# Altium schematic sheet I2C Mux_Sheet.SchDoc
size A4; SheetNumber: 4; SheetTotal: 5
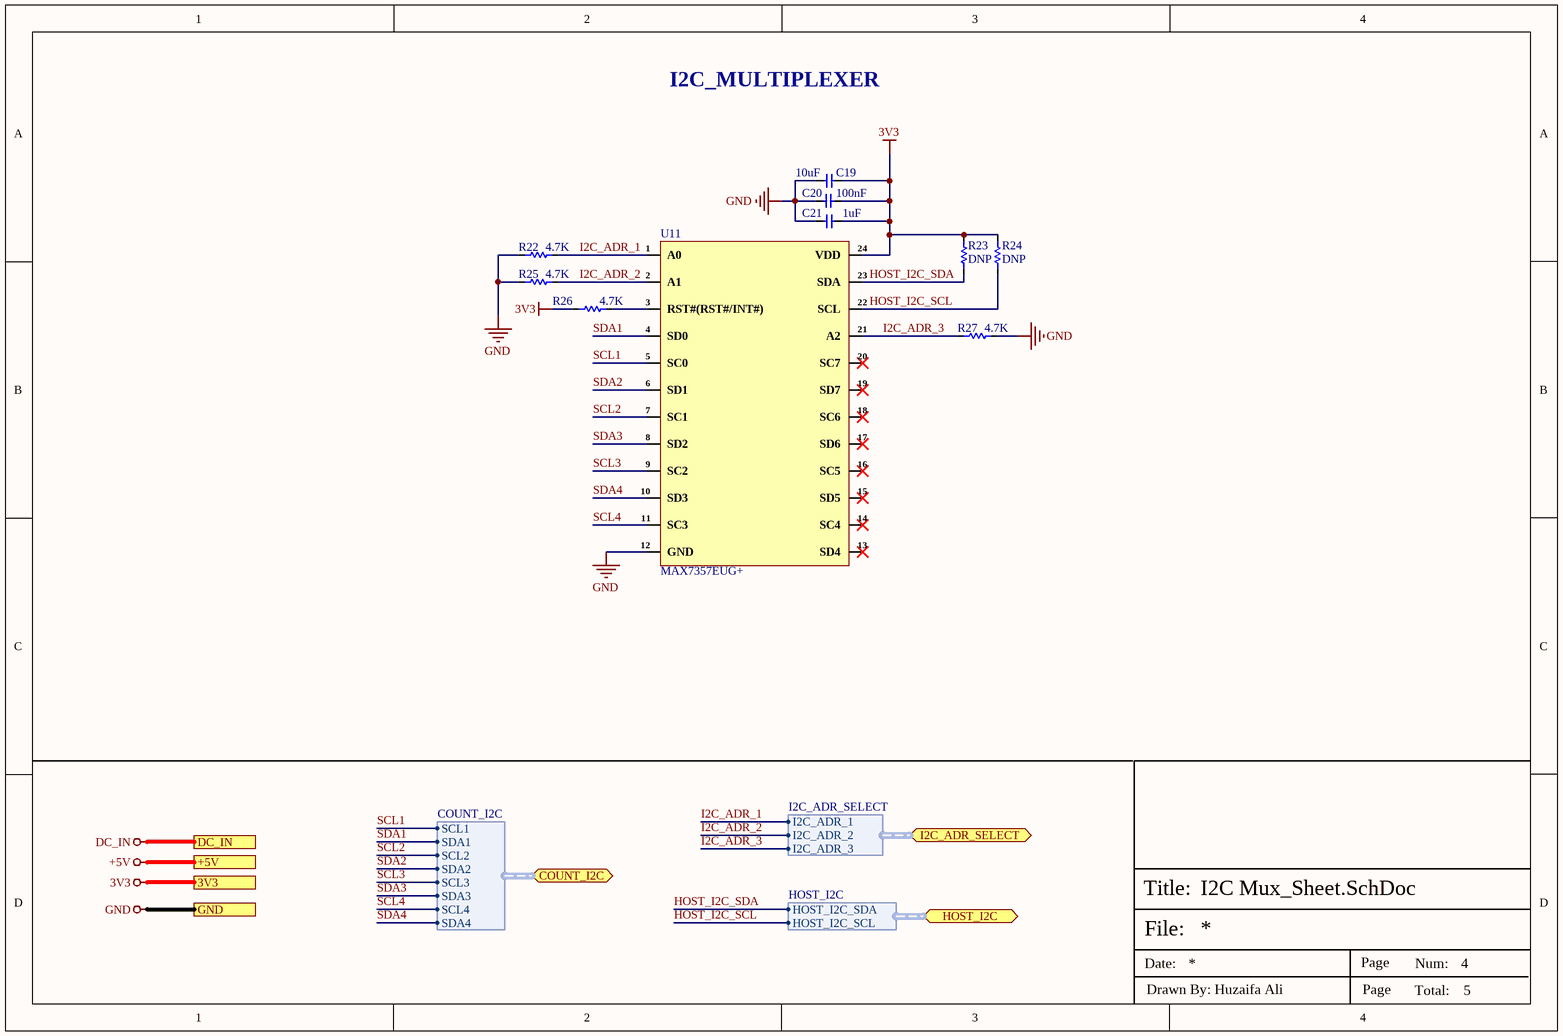
[diagram p0: I2C Mux_Sheet.SchDoc]

## Parts
C19  10uF  [Cap-0603]
C20  100nF  [cap-0402]
C21  1uF  [Cap-0402]
R22  4.7K  [Res-0402]
R23  DNP  [Res-0402]
R24  DNP  [Res-0402]
R25  4.7K  [Res-0402]
R26  4.7K  [Res-0402]
R27  4.7K  [Res-0402]
U11  MAX7357EUG+  [24-TSSOP]

## Ports
3V3, +5V, COUNT_I2C (bidir, harness COUNT_I2C), DC_IN, GND, HOST_I2C (bidir, harness HOST_I2C), I2C_ADR_SELECT (bidir, harness I2C_ADR_SELECT)

## Harnesses
COUNT_I2C: SCL1, SDA1, SCL2, SDA2, SCL3, SDA3, SCL4, SDA4
I2C_ADR_SELECT: I2C_ADR_1, I2C_ADR_2, I2C_ADR_3
HOST_I2C: HOST_I2C_SDA, HOST_I2C_SCL

## Nets
3V3: C19.1 C20.2 C21.1 R23.2 R24.2 R26.1 U11.24(VDD) ; port 3V3
+5V: port +5V
DC_IN: port DC_IN
GND: C19.2 C20.1 C21.2 R22.1 R25.1 R27.2 U11.12(GND) ; port GND
HOST_I2C_SCL: R24.1 U11.22(SCL) ; port HOST_I2C.HOST_I2C_SCL
HOST_I2C_SDA: R23.1 U11.23(SDA) ; port HOST_I2C.HOST_I2C_SDA
I2C_ADR_1: R22.2 U11.1(A0) ; port I2C_ADR_SELECT.I2C_ADR_1
I2C_ADR_2: R25.2 U11.2(A1) ; port I2C_ADR_SELECT.I2C_ADR_2
I2C_ADR_3: R27.1 U11.21(A2) ; port I2C_ADR_SELECT.I2C_ADR_3
SCL1: U11.5(SC0) ; port COUNT_I2C.SCL1
SCL2: U11.7(SC1) ; port COUNT_I2C.SCL2
SCL3: U11.9(SC2) ; port COUNT_I2C.SCL3
SCL4: U11.11(SC3) ; port COUNT_I2C.SCL4
SDA1: U11.4(SD0) ; port COUNT_I2C.SDA1
SDA2: U11.6(SD1) ; port COUNT_I2C.SDA2
SDA3: U11.8(SD2) ; port COUNT_I2C.SDA3
SDA4: U11.10(SD3) ; port COUNT_I2C.SDA4
NetR26_2: R26.2 U11.3(RST#(RST#/INT#))

Not connected (* = marked no-connect by the designer): U11 13(SD4)* 14(SC4)* 15(SD5)* 16(SC5)* 17(SD6)* 18(SC6)* 19(SD7)* 20(SC7)*

## Notes on the sheet
- I2C_MULTIPLEXER
- File:
- Title:
- Date:
- Page
- Num:
- Total:
- Drawn By: Huzaifa Ali

## Library data of the parts
C19 = C1608X5R1E106M080AC: CAP CER 10UF 25V X5R 0603; Manufacturer: TDK; Dielectric Material: Ceramic; Tolerance: 20%; Item Type: Capacitor; Supplier 1: Digi-Key; Manufacturer Part Number: C1608X5R1E106M080AC; Stock 1: 61681; Pricing 1: 1=0.96, 10=0.704, 100=0.483, 500=0.38238, 1000=0.322 (USD); Mount: Surface Mount; Case/Package: 0603; Weight: 7.1E-05oz; Case Code (Imperial): 0603; Case Code (Metric): 1608; Min Operating Temperature: -55°C; Max Operating Temperature: 85°C; Capacitance: 10uF; Packaging: Tape and Reel; Voltage Rating: 25V; Voltage Rating (DC): 25V; Termination: SMD/SMT; Package Quantity: 1; Dielectric: X5R; Composition: Ceramic; Length: 1.6mm; Height: 0.8mm; Width: 0.8mm; Thickness: 0.039inch; Depth: 0.8mm; Lead Free: Lead Free; REACH SVHC: No SVHC; Supplier Part Number 1: 445-9015-1-ND; LCSC Part Number: C2168289
C20 = C1005X7R1H104KT000F: CAP CER 0.1UF 50V X7R 0402; Manufacturer: TDK; Tolerance: 10%; Voltage: 25V; Item Type: Capacitor; Supplier 1: Avnet; Manufacturer Part Number: C1005X7R1H104KT000F; RoHS: No; Category: Ceramic Capacitors; Dielectric: X7R; Supplier Part Number 1: C1005X7R1H104KT000F; LCSC Part Number: C361198; ComponentLink1Description: LCSC; ComponentLink1URL: https://www.lcsc.com/product-detail/Multilayer-Ceramic-Capacitors-MLCC-SMD-SMT_TDK-C1005X7R1H104KT000F_C361198.html
C21 = C1005X5R1V105K050BC: CAP CER 1UF 35V X5R 0402; Manufacturer: TDK; Item Type: Capacitors; Dielectric Material: Ceramic; Material: 4241ConductorMaterial; Tolerance: 10%; Supplier: Digikey; Supplier Part Number: 445-9073-1-ND; Manufacturer Part Number: C1005X5R1V105K050BC; RoHS: Yes; Stock: 682645; Pricing: 1=0.15, 10=0.087, 50=0.061, 100=0.0528, 500=0.03898, 1000=0.03468, 2500=0.03011, 5000=0.02735 (USD); Mounting Technology: Surface Mount; Case/Package: 0402; Case Code (Metric): 1005; Case Code (Imperial): 0402; Min Operating Temperature: -55°C; Max Operating Temperature: 85°C; Value: 1uF; Voltage Rating: 35V; Packaging: Tape and Reel; Dielectric: X5R; Series: C; Length: 1mm; Depth: 0.5mm; Radiation Hardening: No; Reach SVHC Compliant: No; Lead Free: Lead Free; RoHS Compliant: Yes; ComponentLink1URL: https://datasheet.ciiva.com/26834/getdatasheetpartid-750449-26834298.pdf?src-supplier=Verical; ComponentLink1Description: https://datasheet.ciiva.com/26834/getdatasheetpartid-750449-26834298.pdf?src-supplier=Verical; ComponentLink2URL: https://datasheet.ciiva.com/28451/1796654-28451087.pdf?src-supplier=Element14; ComponentLink2Description: https://datasheet.ciiva.com/28451/1796654-28451087.pdf?src-supplier=Element14; ComponentLink3URL: https://datasheet.ciiva.com/22719/1796654-22719533.pdf?src-supplier=Element14; ComponentLink3Description: https://datasheet.ciiva.com/22719/1796654-22719533.pdf?src-supplier=Element14
R22-R27 = RC0402FR-074K7L: RES 4.7K OHM 1% 1/16W 0402; Manufacturer: Yageo; Voltage Rating (DC): 50V; Power Rating: 62.5mW; Resistance: 4.7kR; Temperature Coefficient: 100ppm/°C; Max Power Dissipation: 63mW; Item Type: Resistor; Supplier 1: Avnet; Manufacturer Part Number: RC0402FR-074K7L; RoHS: Yes; Category: Chip SMD Resistors; Stock 1: 2420000; Pricing 1: 10000=0.00085 (USD); Case/Package: 0402; Number of Pins: 2; Case Code (Imperial): 0402; Case Code (Metric): 1005; Size Code: 0402; Min Operating Temperature: -55°C; Max Operating Temperature: 155°C; Tolerance: 1%; Voltage Rating: 50V; Packaging: Tape and Reel; Resistor Type: Thick Film; Termination: SMD/SMT; Features: Moisture Resistant; Series: RC; Number of Terminations: 2; Resistance Tolerance: 1%; Construction: Rectangular; Length: 1mm; Width: 0.5mm; Height: 0.32mm; Depth: 0.5mm; Height - Seated (Max): 0.016inch; RoHS Compliant: Yes; Reach SVHC Compliant: Yes; Military Standard: Not; Lead Free: Lead Free; ComponentLink1URL: https://datasheet.ciiva.com/22661/1686128-22661342.pdf?src-supplier=Element14; ComponentLink1Description: https://datasheet.ciiva.com/22661/1686128-22661342.pdf?src-supplier=Element14; ComponentLink2URL: https://datasheet.ciiva.com/7850/1018594-7850022.pdf?src-supplier=Element14; ComponentLink2Description: https://datasheet.ciiva.com/7850/1018594-7850022.pdf?src-supplier=Element14; ComponentLink3URL: https://datasheet.ciiva.com/7850/1018594-7850023.pdf?src-supplier=Element14; ComponentLink3Description: https://datasheet.ciiva.com/7850/1018594-7850023.pdf?src-supplier=Element14; ComponentLink4URL: https://datasheet.ciiva.com/15215/getdatasheetpartid-328119-15215035.pdf?src-supplier=Verical; ComponentLink4Description: https://datasheet.ciiva.com/15215/getdatasheetpartid-328119-15215035.pdf?src-supplier=Verical; Supplier Part Number 1: RC0402FR-074K7L; LCSC Part Number: C105871
U11 = MAX7357EUG+: IC MULTIPLEXER 8X1 24TSSOP; Manufacturer: Maxim; Supply Type: Single; Propagation Delay: 0.3ns; Max Power Dissipation: 1.11W; Number of Channels: 8; Operating Supply Current: 65uA; Operating Supply Voltage: 5.5V; Supplier: Mouser; LCSC Part Number: C1557096; Manufacturer Part Number: MAX7357EUG+; RoHS: Yes; Category: Interface ICs; Item Type: IC; Pricing: 1=7.78, 10=6.09, 50=4.85, 100=4.47, 1000=4.13, 10000=4.12 (USD); Mounting Technology: Surface Mount; Case/Package: TSSOP; Pins: 24; Min Operating Temperature: -40°C; Max Operating Temperature: 85°C; Packaging: Rail/Tube; Package Quantity: 62; Logic Function: Multiplexer; Series: -; RoHS Compliant: Yes; ComponentLink1URL: https://datasheet.ciiva.com/1676/max7356-max7358-1676412.pdf?src-supplier=Digikey; ComponentLink1Description: https://datasheet.ciiva.com/1676/max7356-max7358-1676412.pdf?src-supplier=Digikey; ComponentLink2URL: https://datasheet.ciiva.com/14295/max7356-max7358-14295500.pdf?src-supplier=Avnet; ComponentLink2Description: https://datasheet.ciiva.com/14295/max7356-max7358-14295500.pdf?src-supplier=Avnet